# Altium schematic sheet Input_Circuit.SchDoc
size B; SheetNumber: 1; SheetTotal: 4
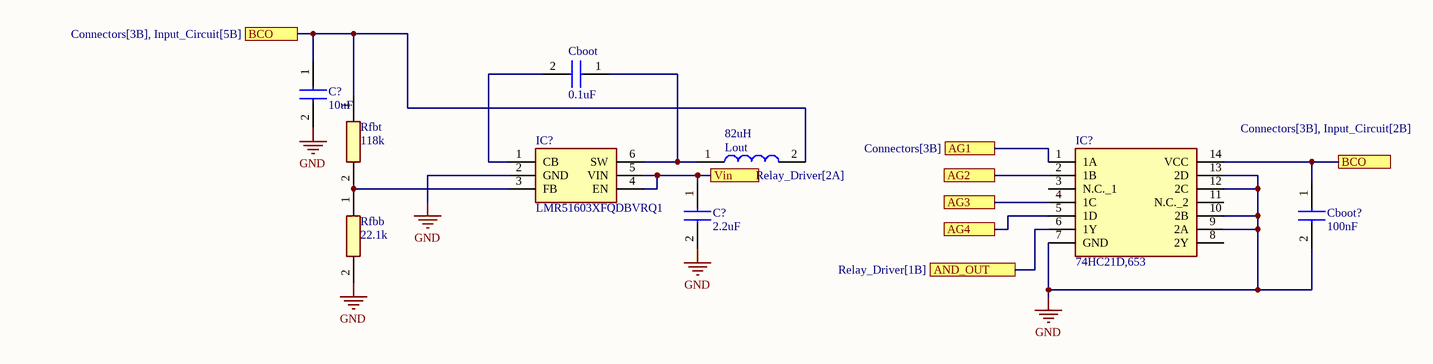
[diagram p0: Input_Circuit.SchDoc]

## Parts
(Parts that share a designator on the sheet are numbered #1, #2 ... from top to bottom, then left to right.)
C?#1  10uF  [CAPC3216X180N]
C?#2  2.2uF  [CAPC3216X180N]
Cboot  0.1uF  [CAPC3216X180N]
Cboot?  100nF  [CAPC3216X180N]
IC?#1  LMR51603XFQDBVRQ1  [SOT95P280X145-6N]
IC?#2  74HC21D,653  [SOIC127P600X175-14N]
Lout  82uH  [INDPM120120X805N]
Rfbb  22.1k  [RESC2012X65N]
Rfbt  118k  [RESC2012X65N]

## Ports
AG1 (see Connectors[3B]), AG2, AG3, AG4, AND_OUT (see Relay_Driver[1B]), BCO (see Connectors[3B], Input_Circuit[2B]), BCO (see Connectors[3B], Input_Circuit[5B]), Vin (see Relay_Driver[2A])

## Nets
GND: C?#1.2 C?#2.2 Cboot?.2 IC?#1.2(GND) IC?#2.7(GND) IC?#2.9(2A) IC?#2.10(2B) IC?#2.12(2C) IC?#2.13(2D) Rfbb.2
AG1: IC?#2.1(1A) ; port AG1
AG2: IC?#2.2(1B) ; port AG2
AG3: IC?#2.4(1C) ; port AG3
AG4: IC?#2.5(1D) ; port AG4
AND_OUT: IC?#2.6(1Y) ; port AND_OUT
BCO: C?#1.1 Cboot?.1 IC?#2.14(VCC) Lout.2 Rfbt.1 ; port BCO
Vin: C?#2.1 IC?#1.4(EN) IC?#1.5(VIN) ; port Vin
NetCboot_1: Cboot.1 IC?#1.6(SW) Lout.1
NetCboot_2: Cboot.2 IC?#1.1(CB)
NetIC?#1_3: IC?#1.3(FB) Rfbb.1 Rfbt.2

Not connected (* = marked no-connect by the designer): IC?#2 3(N.C._1) 8(2Y) 11(N.C._2)

## Library data of the parts
C?#1 C?#2 Cboot Cboot? = CL31B106KBHNNNE: Capacitor; Manufacturer_Name: SAMSUNG; Datasheet Link: https://datasheet.datasheetarchive.com/originals/distributors/DKDS-19/375194.pdf; Height: 1.8mm; Manufacturer_Part_Number: CL31B106KBHNNNE; Mouser Part Number: 187-CL31B106KBHNNNE; Mouser Price/Stock: https://www.mouser.co.uk/ProductDetail/Samsung-Electro-Mechanics/CL31B106KBHNNNE?qs=T0XSgvH75d4ZN8WrMi8xmQ%3D%3D; Arrow Part Number: CL31B106KBHNNNE; Arrow Price/Stock: https://www.arrow.com/en/products/cl31b106kbhnnne/samsung-electro-mechanics.html?utm_currency=USD&region=nac
IC?#1 = LMR51603XFQDBVRQ1: Integrated Circuit; Manufacturer_Name: Texas Instruments; Datasheet Link: https://www.ti.com/lit/gpn/lmr51603-q1; Height: 1.45mm; Manufacturer_Part_Number: LMR51603XFQDBVRQ1; Mouser Part Number: 595-LMR51603XFQDBRQ1; Mouser Price/Stock: https://www.mouser.co.uk/ProductDetail/Texas-Instruments/LMR51603XFQDBVRQ1?qs=olJun0bQHM9FozH0oybAow%3D%3D; Arrow Part Number: LMR51603XFQDBVRQ1; Arrow Price/Stock: https://www.arrow.com/en/products/lmr51603xfqdbvrq1/texas-instruments.html?utm_currency=USD&region=nac
IC?#2 = 74HC21D,653: Integrated Circuit; Manufacturer_Name: Nexperia; Datasheet Link: https://assets.nexperia.com/documents/data-sheet/74HC21.pdf; Height: 1.75mm; Manufacturer_Part_Number: 74HC21D,653; Mouser Part Number: 771-74HC21D-T; Mouser Price/Stock: https://www.mouser.co.uk/ProductDetail/Nexperia/74HC21D653?qs=P62ublwmbi95sLgvsDo8LA%3D%3D; Arrow Part Number: 74HC21D,653; Arrow Price/Stock: https://www.arrow.com/en/products/74hc21d653/nexperia.html?utm_currency=USD&region=asia
Lout = MSS1278-333MLD: Inductor; Manufacturer_Name: COILCRAFT; Datasheet Link: https://www.coilcraft.com/pdfs/mss1278.pdf; Height: 8.05mm; Manufacturer_Part_Number: MSS1278-333MLD; Mouser Part Number: 994-MSS1278-333MLD; Mouser Price/Stock: https://www.mouser.co.uk/ProductDetail/Coilcraft/MSS1278-333MLD?qs=zCSbvcPd3pbln1ZLcloB%252BQ%3D%3D
Rfbb Rfbt = RMCF0805FT10K0: Resistor; Manufacturer_Name: Stackpole Electronics; Datasheet Link: https://www.seielect.com/catalog/sei-rmcf_rmcp.pdf; Height: 0.65mm; Manufacturer_Part_Number: RMCF0805FT10K0; Mouser Part Number: 708-RMCF0805FT10K0; Mouser Price/Stock: https://www.mouser.co.uk/ProductDetail/SEI-Stackpole/RMCF0805FT10K0?qs=IreZ0J%252BReG3LOHc8zdDe6Q%3D%3D; Arrow Part Number: RMCF0805FT10K0; Arrow Price/Stock: https://www.arrow.com/en/products/rmcf0805ft10k0/stackpole-electronics?region=nac